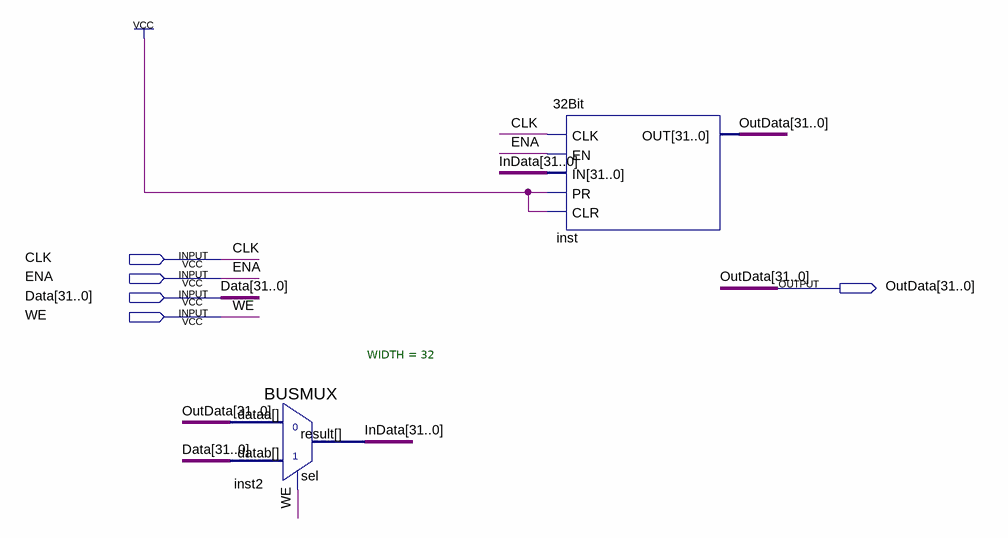
[diagram p0: schematic sheet]
// Quartus schematic W32Bit.bdf as structural Verilog: 2 symbols, 5 pins
module W32Bit (
  input  CLK,
  input  ENA,
  input  [31:0] Data,
  input  WE,
  output [31:0] OutData
);

  wire [31:0] InData;

  BUSMUX #(.WIDTH(32)) inst2 (.datab(Data), .sel(WE), .dataa(OutData), .result(InData));
  \32Bit  inst (.CLK(CLK), .EN(ENA), .IN(InData), .PR(1'b1), .CLR(1'b1), .OUT(OutData));
endmodule
